# EasyEDA Pro project ESP32S3_DMX_RDM_2026-06-09.epro, board PCB_2
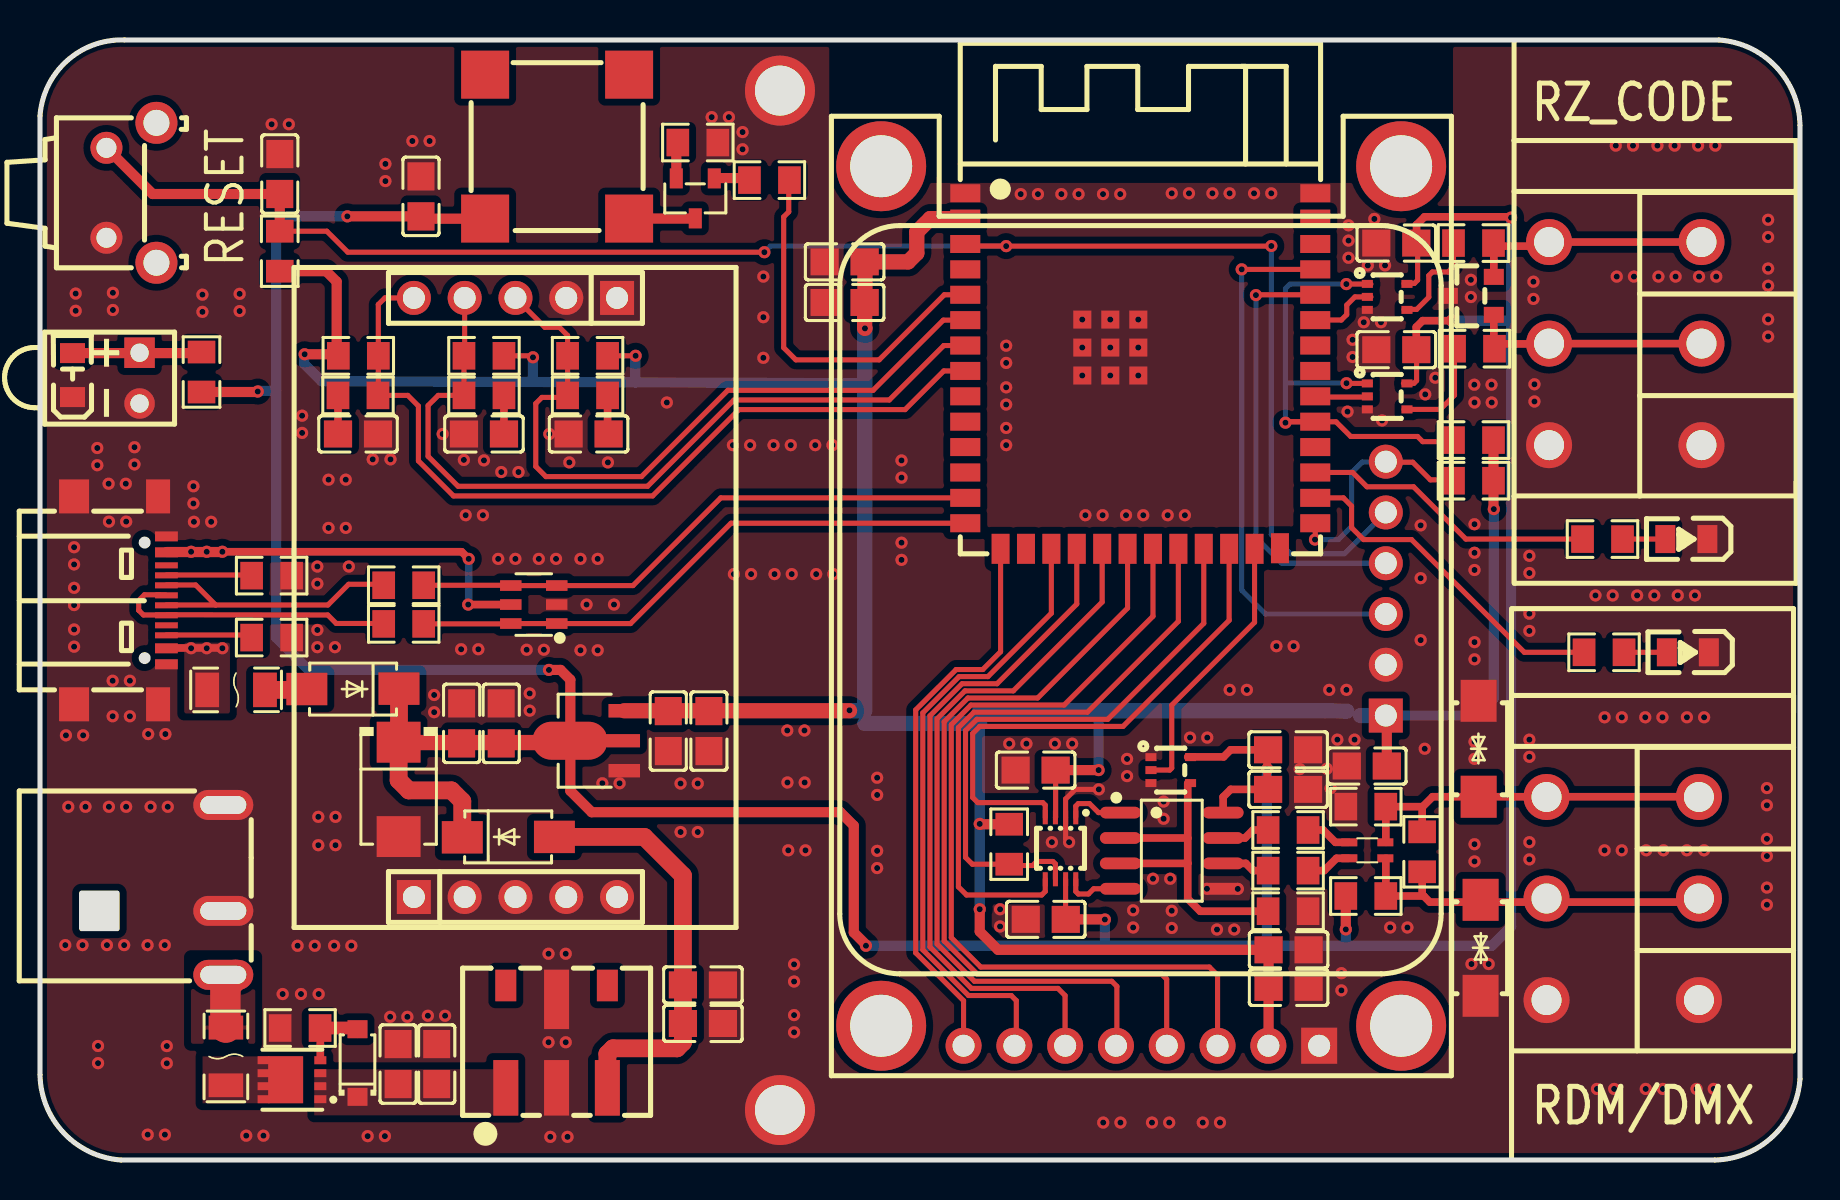
[diagram p19: board, top side]
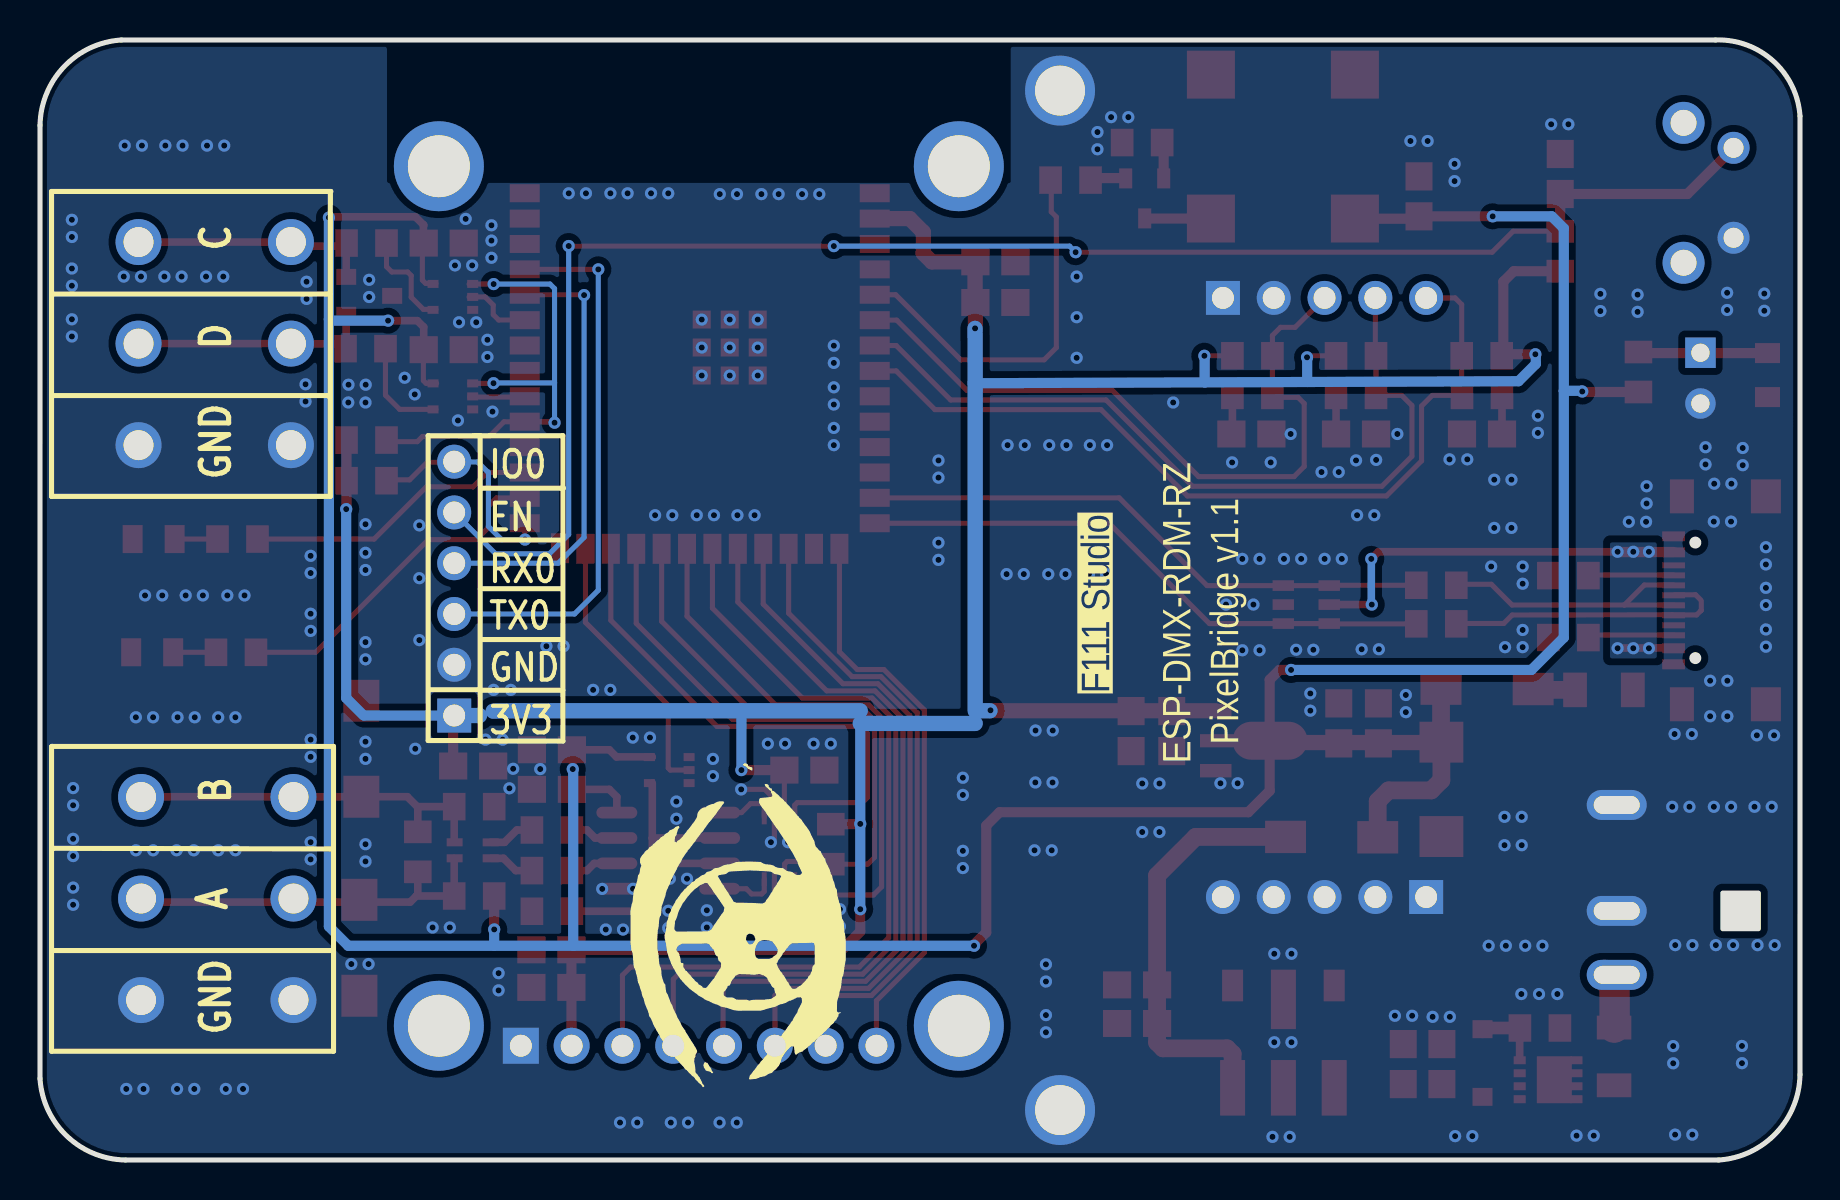
[diagram p20: board, bottom side, seen from below]

Outline 88 x 56.03 mm; copper layers: Top Layer, Bottom Layer. Coordinates in mm from the lower left corner of the outline.
Outline path: 0,52.22 0,4.27 arc(1.2,1.34) 4.06,0 83.74,0 arc(86.66,1.2) 88,4.06 88,51.76 arc(86.81,54.69) 83.94,56.03 4.22,56.03 arc(1.34,54.98) 0,52.22
Stack: Top Layer 0.035mm / Dielectric1 1.51mm FR4 er 4.5 / Bottom Layer 0.035mm

## Design rules (mm)
spacing copperThickness1oz (default): track to track 0.102, other pairs 0.152 to 0.3
spacing copperThickness2oz: track to track 0.203, other pairs 0.152 to 0.3
track width copperThickness1oz (default): min 0.127, default 0.254, max 2.54
track width copperThickness2oz: min 0.203, default 0.254, max 2.54
differential pair differentialPair (default): width min 0.127, default 0.254, max 2.54; gap min 0.152, default 0.152
net VBUS uses copperRegion2_copperThickness1oz
net GND uses copperRegion2_copperThickness1oz
pour e137 uses copperRegion2_default, default
net $2N68 uses copperRegion2_copperThickness1oz
net $2N66 uses copperRegion2_copperThickness1oz
net VCC_24V uses copperRegion
net $1N437 uses copperRegion2_copperThickness1oz

## Placement (name value [footprint] x y rotation side)
C1  100nF  [C0805]  21.08 21.84 270 top
C2  22uF  [C0805]  23.06 21.84 270 top
C3  100nF  [C0805]  50.29 12.04 180 top
C4  100nF  [C0805]  62.41 20.52 180 top
C5  100nF  [C0805]  62.41 18.54 180 top
C6  100nF  [C0805]  40.23 44.93 0 top
C7  100nF  [C0805]  33.45 21.46 90 top
C8  100nF  [C0805]  49.78 19.51 0 top
C9  100nF  [C0805]  66.34 19.71 0 top
C10  22uF  [C0805]  31.41 21.46 90 top
C11  10uF  [C0805]  40.23 42.9 0 top
C12  100nF  [C0805]  11.99 49.33 270 top
C13  100nF  [C0805]  67.82 40.54 0 top
C14  100nF  [C0805]  67.82 45.87 0 top
C15  100nF  [C0805]  62.43 8.64 180 top
C16  22uF  [C0805]  62.43 10.52 180 top
C20  10nF  [C0805]  22.2 36.32 0 top
C21  10nF  [C0805]  27.43 36.32 0 top
C22  10nF  [C0805]  15.9 36.32 180 top
C25  100nF  [C0805]  19.84 4.8 270 top
C26  10uF  [C0805]  17.91 4.8 90 top
C27  100nF  [C0805]  33.15 8.76 180 top
C28  22uF  [C0805]  33.15 6.83 180 top
C29  100nF  [C0805]  19.05 48.21 270 top
CN1  DB142R-5.08-3P-GN  [CONN-TH_3P-P5.08_DIBO_DB142R-5.08-3P]  79.14 13.08 90 top
CN2  DB142R-5.08-3P-GN  [CONN-TH_3P-P5.08_DIBO_DB142R-5.08-3P]  79.27 40.84 90 top
D1  PESD5V0S2BT,215  [SOT-23_L2.9-W1.3-P1.90-LS2.4-BR]  71.54 43.23 0 top
D2  USBLC6-2SC6  [SOT-23-6_L2.9-W1.6-P0.95-LS2.8-BL]  24.69 27.79 90 top
D7  SS34  [SMA_L4.3-W2.6-LS5.0-FD]  23.42 16.15 180 top
D8  SS34  [SMA_L4.3-W2.6-LS5.0-FD]  15.65 23.57 0 top
D9  BZT52C15Q  [SOD-123_L2.6-W1.7-LS3.5-RD]  15.88 4.85 90 top
DC2  DC044  [DC-IN-TH_DC044]  9.16 13.51 0 top
F1  1206L050/36NR  [F1206]  9.8 23.52 180 top
F2  1206L050/36NR  [F1206]  9.3 5.18 270 top
L1  ACM2012-900-2P-T002  [IND-SMD_4P-L2.0-W1.2-TL]  66.37 15.49 0 top
LED1  17-21SURC/S530-A2/4T  [LED0805-RD]  1.63 39.27 90 top
LED2  17-21/GHC-YR1S2/4T  [LED0805-R-RD_GREEN]  82.4 25.4 180 top
LED3  17-21/GHC-YR1S2/4T  [LED0805-R-RD_GREEN]  82.32 31.06 180 top
LED4  MHK1375CRBTD  [LED-TH_MHK1375CRBTD]  4.98 39.12 270 top
M1  -  [1.69_TFT_Mode]  70.56 4.22 180 top
NOREF  -  [Pad_e1178]  37 2.5 0 top
NOREF#2  -  [Pad_e1177]  37 53.5 0 top
Q4  HSBB6115  [DFN-8_L3.0-W3.0-P0.65-BL-1]  12.6 4.02 90 top
Q5  S8050  [SOT-23-3_L2.9-W1.3-P1.90-LS2.4-BR]  32.77 48.11 90 top
R1  10kΩ  [R0805]  11.99 45.47 270 top
R2  10kΩ  [R0805]  71.68 33.98 0 top
R4  5.1kΩ  [R0805]  11.58 29.24 0 top
R5  5.1kΩ  [R0805]  11.58 26.14 0 top
R6  1kΩ  [R0805]  8.08 39.42 270 top
R7  470Ω  [R0805]  78.13 31.06 180 top
R8  470Ω  [R0805]  78.21 25.4 180 top
R9  0Ω  [R0805]  62.41 14.48 180 top
R10  0Ω  [R0805]  62.41 16.51 180 top
R11  33R  [R0805]  71.73 40.59 180 top
R12  120R  [R0805]  69.11 15.42 90 top
R13  33R  [R0805]  71.68 45.87 180 top
R14  10kΩ  [R0805]  71.68 36.02 0 top
R15  10kΩ  [R0805]  62.41 12.45 0 top
R16  10kΩ  [R0805]  48.46 15.8 90 top
R17  1kΩ  [R0805]  66.29 17.68 180 top
R18  1kΩ  [R0805]  66.29 13.21 0 top
R19  0Ω  [R0805]  18.19 26.82 180 top
R20  0Ω  [R0805]  18.19 28.75 0 top
R21  100Ω  [R0805]  22.2 38.25 180 top
R22  100Ω  [R0805]  27.38 38.25 0 top
R23  100Ω  [R0805]  15.9 38.25 0 top
R24  1kΩ  [R0805]  36.47 49.02 180 top
R39  100kΩ  [R0805]  13 6.6 0 top
R40  4.7kΩ  [R0805]  22.2 40.23 0 top
R41  4.7kΩ  [R0805]  27.38 40.23 0 top
R42  4.7kΩ  [R0805]  15.92 40.23 180 top
R44  100Ω  [R0805]  32.89 50.9 180 top
SW1  KH-6X6X5H-ZJ  [SW-TH_KH-6X6X5H-ZJ]  4.57 48.39 270 top
TVS1  SMBJ5.0A  [SMB_L4.6-W3.6-LS5.3-RD]  17.93 18.54 270 top
U1  2.4GHz  [WIRELM-SMD_ESP32-S3-WROOM-1]  55.02 39.47 0 top
U2  THVD1450DR  [SOIC-8_L4.9-W3.9-P1.27-LS6.0-BL]  56.59 15.47 270 top
U3  TXS0102DCUR  [VSON8_L2.0-W2.3-P0.50-LS3.1-BL]  51.03 15.6 180 top
U4  AP7365-33YRG-13  [SOT-89-3_L4.5-W2.5-P1.50-LS4.2-BR]  27.86 20.98 0 top
U5  74HCT1G125GW-Q100H  [TSSOP-5_L2.1-W1.3-P0.65-LS2.2-BL]  56.54 19.51 270 top
U6  BX-PZ2.54-1-6PZZ  [HDR-TH_6P-P2.54-V-M]  67.29 28.59 90 bottom
U7  74HCT1G125GW-Q100H  [TSSOP-5_L2.1-W1.3-P0.65-LS2.2-BL]  67.36 43.18 270 top
U8  74HCT1G125GW-Q100H  [TSSOP-5_L2.1-W1.3-P0.65-LS2.2-BL]  67.36 38.2 270 top
U10  2.731kHz  [BUZ-SMD_4P-L8.5-W8.5-P8.50-TL-A]  25.86 50.7 90 top
U11  2541WV-05P  [HDR-TH_5P-P2.54-V-M]  23.77 13.16 0 top
U12  2541WV-05P  [HDR-TH_5P-P2.54-V-M]  23.77 43.13 180 top
U13  SMAJ12CA  [SMA_L4.3-W2.7-LS5.1-BI]  72.03 10.62 90 top
U14  SMAJ12CA  [SMA_L4.3-W2.7-LS5.1-BI]  71.94 20.57 270 top
U17  K7805MT-500R4  [PWRM-SMD_K78XXMT-500R4]  25.83 6.17 0 top
USB1  TYPE-C 16P QTWT  [USB-TYPE-C-SMD_TYPE-C-16P-QTWT]  4.01 28 270 top

## Footprints (pads in the part's own frame, mm; a bottom-side part is the same pattern mirrored in y, then rotated)
1.69_TFT_Mode
  rect 1.8x1.8 hole 1.1: 1(6.6,-1.5)
  round 1.8 hole 1.1: 2(9.14,-1.5) 3(11.68,-1.5) 4(14.22,-1.5) 5(16.76,-1.5) 6(19.3,-1.5) 7(21.84,-1.5) 8(24.38,-1.5)
  round 4.5 hole 3.1: 9(2.5,-2.5) 9(2.5,-45.5) 9(28.5,-2.5) 9(28.5,-45.5)
BUZ-SMD_4P-L8.5-W8.5-P8.50-TL-A
  rect 2.4x2.4 smd: 1(-3.6,3.6) 2(-3.6,-3.6) 3(3.599,-3.599) 4(3.6,3.6)
C0805
  rect 1.41x1.35 smd: 1(-1,0) 2(1,0)
CONN-TH_3P-P5.08_DIBO_DB142R-5.08-3P
  round 2.3 hole 1.5: 1(-5.08,3.81) 1(-5.08,-3.81) 2(0,3.81) 2(0,-3.81) 3(5.08,3.81) 3(5.08,-3.81)
DC-IN-TH_DC044
  oval 3x1.5 hole 2.3x0.9: 2(0,4.25) 3(0,-1.05) 4(0,-4.25)
DFN-8_L3.0-W3.0-P0.65-BL-1
  rect 0.4x0.6 smd: 1(-0.975,-1.419) 2(-0.325,-1.419) 3(0.325,-1.419) 4(0.975,-1.419) 5(-0.975,1.419) 5(-0.325,1.419) 5(0.325,1.419) 5(0.975,1.419)
  rect 2.35x1.75 smd: 5(0,0.315)
F1206
  rect 1.19x1.728 smd: 1(-1.445,0) 2(1.445,0)
HDR-TH_5P-P2.54-V-M
  rect 1.7x1.7 hole 1.1: 1(-5.08,0)
  round 1.7 hole 1.1: 2(-2.54,0) 3(0,0) 4(2.54,0) 5(5.08,0)
HDR-TH_6P-P2.54-V-M
  rect 1.7x1.7 hole 1.1: 1(-6.35,0)
  round 1.7 hole 1.1: 2(-3.81,0) 3(-1.27,0) 4(1.27,0) 5(3.81,0) 6(6.35,0)
IND-SMD_4P-L2.0-W1.2-TL
  rect 0.8x0.4 smd: 1(-0.901,0.399) 2(-0.899,-0.4) 3(0.9,-0.401) 4(0.901,0.401)
LED0805-R-RD_GREEN
  rect 1x1.399 smd: 1(1.05,0) 2(-1.05,0)
LED0805-RD
  rect 1x1.25 smd: 1(-1.1,0) 2(1.1,0)
LED-TH_MHK1375CRBTD
  rect 1.524x1.524 hole 0.914: 1(-1.27,0)
  round 1.524 hole 0.914: 2(1.27,0)
Pad_e1177
  round 3.5 hole 2.5: 1(0,0)
Pad_e1178
  round 3.5 hole 2.5: 1(0,0)
PWRM-SMD_K78XXMT-500R4
  rect 1.25x2.78 smd: 1(-2.54,-2.56) 2(0,-2.56) 3(2.54,-2.56)
  rect 1.05x1.58 smd: 4(2.54,2.56) 6(-2.54,2.56)
  rect 1.25x2.97 smd: 5(0,1.865)
R0805
  rect 1.133x1.377 smd: 1(-1,0) 2(1,0)
SMA_L4.3-W2.6-LS5.0-FD
  rect 2.046x1.62 smd: 1(-2.304,-0.009) 2(2.304,0.009)
SMA_L4.3-W2.7-LS5.1-BI
  rect 2.1x1.8 smd: 1(-2.4,0) 2(2.4,0)
SMB_L4.6-W3.6-LS5.3-RD
  rect 2.047x2.192 smd: 1(-2.361,0) 2(2.361,0)
SOD-123_L2.6-W1.7-LS3.5-RD
  rect 0.9x1 smd: 1(-1.692,0) 2(1.692,0)
SOIC-8_L4.9-W3.9-P1.27-LS6.0-BL
  oval 0.588x2.045 smd: 1(-1.905,-2.57) 2(-0.635,-2.57) 3(0.635,-2.57) 4(1.905,-2.57) 5(1.905,2.57) 6(0.635,2.57) 7(-0.635,2.57) 8(-1.905,2.57)
SOT-23-3_L2.9-W1.3-P1.90-LS2.4-BR
  rect 1x0.65 smd: 1(1,-0.95) 2(1,0.95) 3(-1,0)
SOT-23-6_L2.9-W1.6-P0.95-LS2.8-BL
  rect 0.532x1.072 smd: 1(-0.95,-1.149) 2(0,-1.149) 3(0.95,-1.149) 4(0.95,1.149) 5(0,1.149) 6(-0.95,1.149)
SOT-23_L2.9-W1.3-P1.90-LS2.4-BR
  rect 1x0.8 smd: 1(1.15,-0.95) 2(1.15,0.95) 3(-1.15,0)
SOT-89-3_L4.5-W2.5-P1.50-LS4.2-BR
  rect 1.575x0.672 smd: 1(1.356,-1.5) 3(1.356,1.5)
  custom 5.377x1.9 smd: 2(-1.356,0)
SW-TH_KH-6X6X5H-ZJ
  round 1.6 hole 1: 1(-2.25,-1.25) 2(2.25,-1.25)
  round 2.1 hole 1.3: 3(-3.5,1.25) 4(3.5,1.25)
TSSOP-5_L2.1-W1.3-P0.65-LS2.2-BL
  rect 0.399x0.551 smd: 1(-0.65,-0.991) 2(0,-0.991) 3(0.65,-0.991) 4(0.65,0.991) 5(-0.65,0.991)
USB-TYPE-C-SMD_TYPE-C-16P-QTWT
  rect 1.7x1.2 smd: 0(-5.2,1.891) 0(5.2,1.891)
  rect 1.7x1.5 smd: 0(-5.2,-2.309) 0(5.2,-2.309)
  rect 0.5x1.14 smd: A1(-3.2,2.308) A4(-2.4,2.308) A9(2.4,2.308) A12(3.2,2.308)
  rect 0.3x1.14 smd: A5(-1.25,2.308) A6(-0.25,2.308) A7(0.25,2.308) A8(1.25,2.309) B5(1.75,2.308) B6(0.75,2.308) B7(-0.75,2.308) B8(-1.75,2.309)
VSON8_L2.0-W2.3-P0.50-LS3.1-BL
  rect 0.25x0.7 smd: 1(-0.762,-1.55) 2(-0.254,-1.55) 3(0.254,-1.55) 4(0.762,-1.55) 5(0.762,1.55) 6(0.254,1.55) 7(-0.254,1.55) 8(-0.762,1.55)
WIRELM-SMD_ESP32-S3-WROOM-1
  rect 1.5x0.9 smd: 1(-8.75,8.895) 2(-8.75,7.625) 3(-8.75,6.355) 4(-8.75,5.085) 5(-8.75,3.815) 6(-8.75,2.545) 7(-8.75,1.275) 8(-8.75,0.005) 9(-8.75,-1.265) 10(-8.75,-2.535) 11(-8.75,-3.805) 12(-8.75,-5.075) 13(-8.75,-6.345) 14(-8.75,-7.615) 27(8.75,-7.615) 28(8.75,-6.345) 29(8.75,-5.075) 30(8.75,-3.805) 31(8.75,-2.535) 32(8.75,-1.265) 33(8.75,0.005) 34(8.75,1.275) 35(8.75,2.545) 36(8.75,3.815) 37(8.75,5.085) 38(8.75,6.355) 39(8.75,7.625) 40(8.75,8.895)
  rect 0.9x1.5 smd: 15(-6.985,-8.895) 16(-5.715,-8.895) 17(-4.445,-8.895) 18(-3.175,-8.895) 19(-1.905,-8.895) 20(-0.635,-8.895) 21(0.635,-8.895) 22(1.905,-8.895) 23(3.175,-8.895) 24(4.445,-8.895) 25(5.715,-8.895) 26(6.985,-8.865)
  rect 0.9x0.9 smd: 41(-2.9,2.575) 41(-2.9,1.175) 41(-2.9,-0.225) 41(-1.5,2.575) 41(-1.5,1.175) 41(-1.5,-0.225) 41(-0.1,2.575) 41(-0.1,1.175) 41(-0.1,-0.225)

## Nets
+3.3V: C6.2 C7.2 C8.2 C9.2 C10.2 C11.2 C15.2 C16.2 M1.2 R1.2 R2.2 R14.2 R16.2 R40.2 R41.2 R42.2 U1.2 U3.3 U4.3 U6.1
+5V: C1.2 C2.2 C3.1 C4.2 C5.2 C13.2 C14.2 C29.2 D7.2 D8.2 R6.2 R18.1 TVS1.1 U2.8 U3.7 U4.2 U5.5 U7.5 U8.5 U10.1
GND: C1.1 C2.1 C3.2 C4.1 C5.1 C6.1 C7.1 C8.1 C9.1 C10.1 C11.1 C12.1 C13.1 C14.1 C15.1 C16.1 C20.1 C21.1 C22.1 C25.1 C26.2 C27.1 C28.1 C29.1 CN1.1 CN2.1 D1.3 D2.2 DC2.2 DC2.3 LED1.1 LED2.2 LED3.2 LED4.2 M1.1 NOREF.1 NOREF#2.1 R4.2 R5.2 R15.2 R17.2 R39.1 R44.1 SW1.2 TVS1.2 U1.1 U1.40 U1.41 U2.5 U3.2 U4.1 U5.1 U5.3 U6.2 U7.3 U8.3 U11.1 U11.2 U11.3 U11.4 U11.5 U12.1 U12.2 U13.1 U14.1 U17.2 U17.5 USB1.0 USB1.A1 USB1.A12
VBUS: D2.5 F1.2 USB1.A4 USB1.A9
VCC_24V: DC2.4 F2.1
A: R21.2 R40.1 U1.7 U12.4
B: R23.2 R42.1 U1.8 U12.5
BEEP: R24.1 U1.5
DMX_EN: U1.25 U5.2
DMX_OE: R16.1 U1.23 U3.6
DMX_RX: U1.24 U3.4
DMX_TX: U1.22 U3.5
EN: C12.2 R1.1 SW1.1 U1.3 U6.5
ENCODER_A: C20.2 R21.1
ENCODER_B: C22.2 R23.1
ENCODER_KEY: C21.2 R22.2
IO0: R2.1 U1.27 U6.6
IO3: M1.8 U1.15
IO4: U1.4
IO8: U1.12
IO9: M1.7 U1.17
IO10: M1.6 U1.18
IO11: M1.5 U1.19
IO12: M1.4 U1.20
IO13: M1.3 U1.21
IO16: U1.9
IO17: U1.10
IO18: U1.11
IO35: R8.2 U1.28
IO36: R7.2 U1.29
IO37: U1.30
IO40: U1.33
IO41: U1.34
IO45: U1.26
IO46: U1.16
KEY: R22.1 R41.1 U1.6 U12.3
RXD0: U1.36 U6.4
RZ_CLK: U1.35 U7.2
RZ_DATA: U1.32 U8.2
RZ_OE: R14.1 U1.31 U7.1 U8.1
TXD0: U1.37 U6.3
USB_DN: D2.3 D2.4 R20.2 U1.13
USB_DP: D2.1 D2.6 R19.1 U1.14
$1N204: R4.1 USB1.A5
$1N205: R5.1 USB1.B5
$1N232: U1.39
$1N233: U1.38
$1N288: R15.1 U2.2 U2.3 U5.4
$1N299: R11.2 U8.4
$1N306: U2.1 U3.1
$1N311: U2.4 U3.8
$1N321: CN2.2 D1.1 R11.1
$1N328: R13.2 U7.4
$1N333: CN2.3 D1.2 R13.1
$1N343: LED2.1 R8.1
$1N352: CN1.3 L1.4 R12.2 R17.1 U14.2
$1N354: CN1.2 L1.3 R12.1 R18.2 U13.2
$1N357: R10.2 U2.7
$1N358: R9.2 U2.6
$1N359: LED3.1 R7.1
$1N412: R19.2 USB1.A6 USB1.B6
$1N414: R20.1 USB1.A7 USB1.B7
$1N435: LED1.2 LED4.1 R6.1
$1N437: D8.1 F1.1
$1N442: L1.1 R10.1
$1N443: L1.2 R9.1
$2N13: D9.2 Q4.4 R39.2
$2N41: C27.2 C28.2 D7.1 U17.3
$2N58: Q5.3 U10.2
$2N66: C25.2 C26.1 D9.1 Q4.1 Q4.2 Q4.3 U17.1
$2N68: F2.2 Q4.5
$2N72: Q5.1 R24.2
$2N73: Q5.2 R44.2

Pads without a net: M1 9; SW1 3 4; U10 3 4; U17 4 6; USB1 A8 B8

## Via types
v1: diameter 0.61, hole 0.305, Top Layer to Bottom Layer, 378 vias

## Routing (per net, layer and track width the routed paths; a pad name or vN(x,y) marks a point on that pad's centre or on a via; arc(x,y) is an arc through that point)
+3.3V: length 169.5
  Top Layer w0.254: R40.2 24.57,40.23 v1(24.65,40.16) ; 28.73,40.23 v1(29.78,40.23) ; U3.3 50.78,17.16 C8.2
  Top Layer w0.508: R14.2 R2.2 72.68,32.58 v1(72.69,32.56) ; 14.84,40.31 v1(13.23,40.31) ; 14.84,40.31 R42.2 ; 14.84,40.31 14.83,40.32 14.83,43.94 14.31,44.47 R1.2 ; M1.2 61.43,5.73 C15.2 C16.2 47.9,10.52 46.99,11.43 v1(46.99,12.55) ; C8.2 v1(52.93,19.51) ; U6.1 67.34,22.19 C9.2 ; R16.2 47.01,16.8 v1(46.99,16.81)
  Top Layer w0.762: U4.3 40.48,22.48 ; U1.2 44.51,47.1 43.84,46.42 43.84,45.36 43.41,44.93 41.25,44.93 41.25,42.92 C11.2 41.23,41.62 v1(41.25,41.61)
  Top Layer w0.889: C6.2 41.25,44.93
  Bottom Layer w0.508: v1(29.78,40.23) 29.77,40.22 29.77,38.9 ; 41.24,38.86 29.77,38.9 ; 29.77,38.9 24.64,38.92 ; 71.82,22.24 72.69,23.11 v1(72.69,32.56) ; 24.64,38.92 24.64,40.15 v1(24.65,40.16) ; 24.64,38.92 14.07,38.96 13.21,39.83 13.21,40.26 ; U6.1 71.77,22.24 ; v1(46.99,12.55) v1(46.99,16.81) 46.99,22.47 ; 52.94,22.47 52.93,22.47 52.93,19.51 v1(52.93,19.51)
  Bottom Layer w0.762: 65.35,22.46 64.24,22.48 52.94,22.47 46.99,22.47 ; 66.03,22.24 U6.1 ; v1(41.25,41.61) 41.24,38.86 41.24,22.47 ; 41.24,21.84 46.99,21.84 ; 40.5,22.47 41.21,22.47
  vias: v1(40.48,22.5)
+5V: length 206.1
  Top Layer w0.254: 68.82,40.74 68.83,40.73 68.83,38.99 68.7,38.86 68.18,38.86 ; 68.83,45.88 68.82,45.9 ; U3.7 51.28,12.05 C3.1 ; 68.88,45.69 68.88,44.02 68.72,43.86 68.21,43.86
  Top Layer w0.381: 61.36,20.52 61.36,18.54 ; 61.36,20.52 59.54,20.52 59.18,20.17 57.4,20.17 57.39,20.16 ; 61.36,20.52 C4.2 ; 61.36,18.54 C5.2 ; 61.36,18.54 59.54,18.54 59.16,18.17 U2.8 ; 68.82,40.74 68.82,41.67 69.14,41.99 v1(70.6,41.99) ; 68.83,45.76 68.76,45.69 ; 68.81,46.76 68.83,46.79 ; 68.83,46.79 69.23,47.19 73.49,47.19 73.54,47.14 ; 68.83,46.79 68.83,45.88
  Top Layer w0.508: v1(25.45,24.52) 26.03,24.52 26.52,24.03 26.52,20.96 ; R18.1 v1(65.29,11.54) ; R6.2 10.86,38.42 v1(10.89,38.45) ; 26.52,20.96 26.52,18.47 27.59,17.4 40.02,17.4 40.69,16.73 40.69,11.38 41.31,10.77 ; 26.52,20.96 26.5,20.98 ; 19.05,47.09 22.25,47.09 22.26,47.1 ; v1(53.25,12.03) 53.24,12.04 C3.1 ; C29.2 v1(15.37,47.21)
  Top Layer w0.762: 18.24,20.88 26.41,20.88
  Top Layer w0.889: D8.2 17.95,20.92 TVS1.1 17.93,19 18.44,18.49 20.57,18.49 21.11,17.95 D7.2
  Bottom Layer w0.508: v1(41.3,10.72) 53.25,10.72 ; 53.25,10.72 v1(53.25,12.03) ; 53.25,10.72 61.34,10.72 ; v1(61.37,19.56) 61.34,19.54 61.34,10.72 ; 11.81,38.48 10.92,38.48 v1(10.89,38.45) ; 11.81,38.48 11.81,26.14 13.43,24.52 v1(25.45,24.52) ; 11.81,38.48 11.81,46.61 12.41,47.21 v1(15.37,47.21) ; 65.3,10.72 72.59,10.72 73.56,11.68 73.56,42.06 ; 65.3,10.72 65.3,11.53 ; 65.3,10.72 61.34,10.72 ; v1(70.6,41.99) 73.49,41.99 73.56,42.06 ; 73.56,42.06 v1(73.56,47.15)
GND: length 4.1
  Top Layer w0.254: v1(51.46,15.9) 51.28,16.08 U3.2 51.28,18.06 51.76,18.54 v1(52.94,18.54)
  vias: v1(1.3,21.25) v1(1.26,10.75) v1(1.41,17.67) v1(1.7,30.66) v1(1.7,29.8) v1(1.7,28.62) v1(1.7,27.76) v1(1.7,26.54) v1(1.7,25.68) v1(1.78,43.35) v1(1.78,42.48) v1(2.12,10.75) v1(2.16,21.25) v1(2.28,17.67) v1(2.86,35.62) v1(2.86,34.76) v1(2.9,5.71) v1(2.9,4.85) v1(3.35,10.75) v1(3.43,33.83) v1(3.45,31.94) v1(3.45,17.67) v1(3.64,43.39) v1(3.64,42.52) v1(3.63,23.98) v1(3.63,22.2) v1(4.21,10.75) v1(4.29,33.83) v1(4.31,31.94) v1(4.31,17.67) v1(4.49,23.98) v1(4.49,22.2) v1(4.72,35.66) v1(4.72,34.8) v1(5.41,21.31) v1(5.38,10.75) v1(5.39,1.27) v1(5.53,17.67) v1(6.24,10.75) v1(6.25,1.27) v1(6.27,21.31) v1(6.34,5.7) v1(6.34,4.84) v1(6.39,17.67) v1(7.67,33.71) v1(7.67,32.84) v1(7.7,31.93) v1(8.12,43.29) v1(8.12,42.43) v1(8.56,31.93) v1(9.98,43.33) v1(9.98,42.47) v1(10.31,1.22) v1(11.17,1.22) v1(11.58,51.82) v1(12.13,8.3) v1(12.44,51.82) v1(12.88,10.72) v1(13.05,8.3) v1(13.11,37.24) v1(13.11,36.38) v1(13.74,10.72) v1(13.87,29.69) v1(13.87,28.83) v1(13.87,26.52) v1(13.87,25.66) v1(13.92,17.17) v1(13.92,15.75) v1(13.93,8.3) v1(14.43,34.04) v1(14.43,31.62) v1(14.75,25.66) v1(14.71,10.72) v1(14.78,17.17) v1(14.78,15.75) v1(15.29,34.04) v1(15.29,31.62) v1(15.44,29.69) v1(15.57,10.72) v1(16.38,1.2) v1(16.64,35.05) v1(17.25,1.2) v1(17.27,49.83) v1(17.27,48.97) v1(17.53,35.05) v1(17.51,7.16) v1(18.37,7.16) v1(18.62,50.98) v1(19.4,7.22) v1(19.48,50.98) v1(19.71,23.27) v1(19.71,22.4) v1(20.13,36.32) v1(20.26,7.22) v1(21.06,25.55) v1(21.19,35.02) v1(21.29,32.26) v1(21.92,25.55) v1(22.15,32.26) v1(22.2,35) v1(22.91,30.07) v1(23.06,34.42) v1(23.77,30.07) v1(23.93,34.42) v1(24.33,25.53) v1(24.49,23.34) v1(24.49,22.48) v1(24.94,30.07) v1(25.2,25.53) v1(25.43,10.32) v1(25.43,5.89) v1(25.47,36.32) v1(25.52,1.16) v1(25.8,30.07) v1(26.29,10.32) v1(26.29,5.89) v1(26.38,1.16) v1(26.47,34.9) v1(27.03,30.07) v1(27.03,25.5) v1(27.33,27.79) v1(27.89,30.07) v1(27.89,25.5) v1(28.12,18.85) v1(28.4,34.9) v1(28.7,27.79) v1(28.98,18.85) v1(31.34,37.9) v1(32.03,18.84) v1(32.03,16.41) v1(32.89,18.84) v1(32.89,16.41) v1(33.59,52.17) v1(34.45,52.17) v1(34.65,35.76) v1(34.7,29.31) v1(35.13,51.42) v1(35.13,50.56) v1(35.51,35.76) v1(35.56,29.31) v1(36.17,44.2) v1(36.17,42.16) v1(36.17,40.13) v1(36.68,35.76) v1(36.73,29.31) v1(37.37,21.49) v1(37.38,18.89) v1(37.42,15.49) v1(37.54,35.76) v1(37.59,29.31) v1(37.71,9.79) v1(37.71,8.93) v1(37.71,7.25) v1(37.71,6.39) v1(38.23,21.49) v1(38.24,18.89) v1(38.28,15.49) v1(38.76,35.76) v1(38.81,29.31) v1(39.62,35.76) v1(39.67,29.31) v1(41.86,19.12) v1(41.86,18.26) v1(41.86,15.47) v1(41.86,14.61) v1(43.08,35) v1(43.08,34.14) v1(43.08,30.88) v1(43.08,30.02) v1(48.01,12.54) v1(48.01,11.68) v1(48.31,40.74) v1(48.31,39.88) v1(48.31,38.66) v1(48.31,37.8) v1(48.31,36.62) v1(48.31,35.76) v1(48.46,20.83) v1(49.04,48.32) v1(49.32,20.83) v1(49.9,48.32) v1(50.6,15.9) v1(50.75,20.83) v1(51.07,48.32) v1(51.61,20.83) v1(51.93,48.32) v1(52.12,42.05) v1(52.12,40.65) v1(52.12,39.25) v1(52.27,32.26) v1(53.13,32.26) v1(53.15,48.32) v1(53.16,1.87) v1(53.52,42.05) v1(53.52,40.65) v1(53.52,39.25) v1(54.01,48.32) v1(54.02,1.87) v1(54.31,32.26) v1(54.36,20.07) v1(54.36,19.21) v1(54.66,12.49) v1(54.66,11.63) v1(54.92,42.05) v1(54.92,40.65) v1(54.92,39.25) v1(55.17,32.26) v1(55.6,1.87) v1(55.65,14.07) v1(56.19,17.93) v1(56.19,17.07) v1(56.39,32.26) v1(56.51,14.07) v1(56.46,1.87) v1(56.59,48.36) v1(56.59,12.47) v1(56.59,11.61) v1(57.25,32.26) v1(57.45,48.36) v1(57.51,21.13) v1(58.14,1.87) v1(58.35,13.57) v1(58.37,21.13) v1(58.62,48.36) v1(58.85,11.53) v1(59,1.87) v1(59.48,48.36) v1(59.49,23.52) v1(59.71,11.53) v1(59.89,13.56) v1(60.35,23.52) v1(60.71,48.36) v1(61.57,48.36) v1(61.82,25.7) v1(62.68,25.7) v1(62.99,19.56) v1(64.35,19.57) v1(64.47,23.52) v1(64.53,18.6) v1(64.87,21.03) v1(65.07,9.35) v1(65.07,8.49) v1(65.33,23.52) v1(65.43,46.76) v1(65.43,46) v1(65.43,45.14) v1(65.38,37.44) v1(65.63,41.03) v1(65.63,40.17) v1(65.73,21.03) v1(66.19,41.91) v1(66.4,44.75) v1(66.72,47.08) v1(67.05,41.91) v1(67.11,37) v1(67.26,44.75) v1(67.51,11.63) v1(68.37,11.63) v1(69.04,31.75) v1(69.04,29.11) v1(69.04,26.01) v1(69.24,20.57) v1(69.27,38.3) v1(69.77,39.13) v1(71.55,44.03) v1(71.55,43.17) v1(71.58,9.8) v1(71.72,38.79) v1(71.73,37.9) v1(71.73,31.81) v1(71.73,30.38) v1(71.73,29.52) v1(71.73,25.91) v1(71.73,25.05) v1(71.73,20.93) v1(71.73,20.07) v1(71.73,15.8) v1(71.73,14.94) v1(72.44,9.8) v1(72.58,38.79) v1(72.59,37.9) v1(74.47,30.23) v1(74.47,29.37) v1(74.47,27.33) v1(74.47,26.47) v1(74.47,21.03) v1(74.47,20.17) v1(74.47,15.9) v1(74.47,15.04) v1(74.68,43.94) v1(74.68,43.08) v1(74.73,38.81) v1(74.73,37.95) v1(77.78,28.25) v1(77.85,3.56) v1(78.24,22.15) v1(78.23,15.49) v1(78.64,28.25) v1(78.71,3.56) v1(78.79,50.75) v1(78.84,44.2) v1(79.1,22.15) v1(79.09,15.49) v1(79.65,50.75) v1(79.7,44.2) v1(79.86,28.25) v1(80.27,22.15) v1(80.31,15.49) v1(80.29,3.56) v1(80.72,28.25) v1(80.88,50.75) v1(80.92,44.2) v1(81.13,22.15) v1(81.18,15.49) v1(81.15,3.56) v1(81.74,50.75) v1(81.78,44.2) v1(81.89,28.25) v1(82.35,22.15) v1(82.35,15.49) v1(82.75,28.25) v1(82.83,3.56) v1(82.91,50.75) v1(82.96,44.2) v1(83.21,22.15) v1(83.21,15.49) v1(83.69,3.56) v1(83.77,50.75) v1(83.82,44.2) v1(86.35,18.61) v1(86.35,17.75) v1(86.35,16.07) v1(86.35,15.21) v1(86.35,13.63) v1(86.35,12.77) v1(86.41,47.04) v1(86.41,46.18) v1(86.41,44.6) v1(86.41,43.74) v1(86.41,42.06) v1(86.41,41.2)
VBUS: length 22.5
  Top Layer w0.381: 9.05,25.62 6.32,25.62 ; v1(9.12,25.6) 9.08,25.65 ; v1(21.44,30.07) 21.08,30.43 v1(9.12,30.43) ; D2.5 v1(21.41,27.79)
  Top Layer w0.508: 6.32,30.42 9.11,30.42 v1(9.12,30.43)
  Bottom Layer w0.381: v1(21.44,30.07) 21.44,27.81 v1(21.41,27.79)
  vias: v1(7.56,30.43) v1(7.56,25.6) v1(8.34,30.43) v1(8.34,25.6)
VCC_24V: length 2.9
  Top Layer w1.524: F2.1 9.27,6.65 9.27,8.76 9.77,9.26
A: length 39.8
  Top Layer w0.254: R21.2 R40.1 21.23,40.27 U12.4 ; 21.15,38.25 19.91,38.25 19.41,37.74 19.41,35.2 20.9,33.71 30.38,33.71 34.7,38.02 42.47,38.02 45.19,40.75 U1.7
B: length 42.1
  Top Layer w0.254: U1.8 45.19,39.48 43.26,37.54 34.95,37.54 30.63,33.22 20.68,33.22 18.92,34.98 18.92,37.72 18.39,38.25 R23.2 16.92,38.27 R42.1 16.92,42.8 17.25,43.13 U12.5
BEEP: length 19.2
  Top Layer w0.254: U1.5 45.22,43.29 41.96,40.03 37.79,40.03 37.19,40.64 37.19,47.18 37.44,47.44 37.44,48.99 R24.1
DMX_EN: length 13.4
  Top Layer w0.254: 55.69,19.51 56.49,19.51 56.59,19.61 56.59,22.76 60.73,26.9 60.73,30.37
DMX_OE: length 29.6
  Top Layer w0.254: U3.6 50.77,14.81 50.65,14.94 49.84,14.94 49.63,14.73 48.53,14.73 R16.1 46.62,14.8 46.28,15.14 46.28,21.48 46.84,22.05 53.39,22.05 58.19,26.85 58.19,30.37
DMX_RX: length 26.1
  Top Layer w0.254: U3.4 50.27,17.75 50.14,17.88 46.89,17.88 46.63,18.14 46.63,21.34 46.99,21.69 54.15,21.69 59.46,27 59.46,30.37
DMX_TX: length 29.8
  Top Layer w0.254: 56.92,30.37 56.92,26.95 52.38,22.4 46.69,22.4 45.92,21.63 45.92,13.67 46.33,13.26 50.09,13.26 50.27,13.44 U3.5
EN: length 85.6
  Top Layer w0.254: v1(61.57,45.72) 61.56,45.72 v1(48.31,45.72) 48.31,45.72 46.69,45.72 ; R1.1 14.34,46.47 15.39,45.42 v1(36.22,45.42) ; 46.69,45.72 46.37,45.72 U1.3 46.59,45.83 46.69,45.72
  Top Layer w0.508: R1.1 C12.2 5.63,48.33 SW1.1
  Bottom Layer w0.254: v1(61.57,45.72) 61.57,31.29 62.53,30.33 65.23,30.33 U6.5 ; v1(48.31,45.72) 36.53,45.72 v1(36.22,45.42)
ENCODER_A: length 1.9
  Top Layer w0.381: C20.2 R21.1
ENCODER_B: length 2
  Top Layer w0.381: 14.9,36.27 R23.1
ENCODER_KEY: length 2
  Top Layer w0.381: C21.2 28.38,36.37 R22.2
IO0: length 11.7
  Top Layer w0.254: U1.27 63.77,31.05 v1(63.75,31.04) ; 67.28,34.91 68.64,34.91 69.52,34.03 70.62,34.03
  Bottom Layer w0.254: 65.58,34.42 65.58,31.7 64.92,31.04 v1(63.75,31.04) ; 65.62,34.42 66.12,34.92 67.28,34.92 ; 66.97,35.31 67.29,34.99
IO3: length 28.2
  Top Layer w0.254: M1.8 46.18,7.97 43.79,10.37 43.79,22.52 45.81,24.54 47.14,24.54 48.03,25.43 48.03,30.37
IO9: length 31.4
  Top Layer w0.254: M1.7 48.82,5.81 48.82,7.98 48.56,8.23 46.43,8.23 44.14,10.51 44.14,22.37 45.96,24.18 47.4,24.18 50.57,27.36 50.57,30.37
IO10: length 34.1
  Top Layer w0.254: M1.6 51.26,5.72 51.26,8.23 50.9,8.59 46.57,8.59 44.5,10.66 44.5,22.22 46.1,23.83 47.86,23.83 51.84,27.81 51.84,30.37
IO11: length 37.3
  Top Layer w0.254: 53.8,5.72 53.85,5.76 53.85,8.69 53.59,8.94 46.72,8.94 44.85,10.81 44.85,22.07 46.25,23.47 48.67,23.47 53.11,27.91 53.11,30.37
IO12: length 40.5
  Top Layer w0.254: 54.38,30.37 54.38,27.61 49.89,23.11 46.4,23.11 45.21,21.93 45.21,10.96 46.87,9.3 56.08,9.3 56.34,9.04 56.34,5.72 M1.4
IO13: length 43.8
  Top Layer w0.254: 55.65,30.37 55.65,27.2 51.21,22.76 46.55,22.76 45.57,21.78 45.57,11.13 47.04,9.65 58.47,9.65 58.88,9.24 M1.3
IO35: length 17.3
  Top Layer w0.254: R8.2 74.22,25.4 68.58,31.04 66.18,31.04 65.58,31.64 65.58,32.72 65.17,33.13 U1.28
IO36: length 14.7
  Top Layer w0.254: U1.29 65.63,34.4 66.35,33.68 68.68,33.68 71.3,31.06 R7.2
KEY: length 36.2
  Top Layer w0.254: U1.6 45.17,42.02 41.66,38.51 34.39,38.51 30.07,34.19 25.3,34.19 24.79,34.7 24.79,37.85 25.09,38.15 26.28,38.15 R22.1 R41.1 26.38,41.25 25.97,41.66 25.25,41.66 U12.3
RXD0: length 22.3
  Top Layer w0.254: v1(60.8,43.27) 60.82,43.29 U1.36
  Bottom Layer w0.254: 67.69,29.46 67.8,29.35 ; v1(60.8,43.27) 60.8,31.15 62.09,29.86 U6.4
RZ_CLK: length 3.5
  Top Layer w0.254: 63.77,42.02 65.07,42.02 65.34,42.29 ; 66.55,43.18 65.75,43.18 65.34,42.77 65.34,42.29
RZ_DATA: length 2.9
  Top Layer w0.254: 63.58,38.17 66.52,38.17
RZ_OE: length 25.4
  Top Layer w0.254: v1(65.33,38.86) 65.34,38.85 66.51,38.85 ; v1(65.32,43.82) 66.55,43.82 ; 70.52,35.94 69.14,35.94 68.88,36.2 65.54,36.2 64.81,36.93 62.32,36.93 ; U1.31 62.33,36.94
  Top Layer w0.381: 62.32,36.93 v1(62.28,36.89)
  Bottom Layer w0.254: v1(62.28,36.89) 62.28,38.88 ; 62.28,38.88 65.32,38.88 v1(65.33,38.86) ; 62.28,38.88 62.28,43.59 62.5,43.82 v1(65.32,43.82)
TXD0: length 27.4
  Top Layer w0.254: U1.37 v1(60.09,44.56)
  Bottom Layer w0.254: U6.3 61.28,27.32 60.09,28.51 v1(60.09,44.56) ; 67.79,26.82 67.8,26.81
USB_DN: length 28.9
  Top Layer w0.254: U1.13 34.04,33.13 29.65,28.74 D2.3 D2.4 23.52,28.75 R20.2
USB_DP: length 29.2
  Top Layer w0.254: U1.14 34.55,31.86 29.53,26.84 D2.1 D2.6 23.52,26.82 R19.1
$1N204: length 4.3
  Top Layer w0.254: 6.32,29.27 10.55,29.27 R4.1
$1N205: length 4.4
  Top Layer w0.254: 10.5,26.01 10.58,25.93 ; R5.1 10.45,26.27 6.32,26.27
$1N288: length 16.8
  Top Layer w0.381: 57.39,18.86 57.39,16.1 ; 57.39,16.1 57.38,16.11 54.02,16.11 ; 57.39,16.1 57.39,14.85 ; 57.39,14.85 57.39,13.07 58.01,12.45 R15.1 ; 57.39,14.85 57.38,14.84 54.02,14.84
$1N299: length 5.5
  Top Layer w0.254: 70.73,41 70.73,38.26 70.02,37.55 68.21,37.55
$1N306: length 3
  Top Layer w0.254: U3.1 51.79,17.7 51.92,17.83 52.48,17.83 52.93,17.38 54.02,17.38
$1N311: length 3
  Top Layer w0.254: 54.02,13.57 52.69,13.57 52.43,13.31 51.92,13.31 51.79,13.44 U3.8
$1N321: length 11.9
  Top Layer w0.381: 75.67,40.83 72.66,40.83 72.63,40.86 ; 72.69,41.03 D1.1 ; 83.21,40.84 75.59,40.84
$1N328: length 5.4
  Top Layer w0.254: 69.44,43.16 68.84,42.55 68.21,42.55 ; 70.68,46.08 70.68,44.69 70.41,44.43 69.62,44.43 69.44,44.25 69.44,43.17
$1N333: length 11.9
  Top Layer w0.381: 83.21,45.92 75.59,45.92 ; 75.59,45.72 72.76,45.72 72.69,45.79 72.69,44.38
$1N343: length 2.1
  Top Layer w0.254: R8.1 LED2.1
$1N352: length 19.2
  Top Layer w0.381: 67.29,15.89 67.29,17.68 ; R12.2 69.11,17.68 ; 69.11,17.68 R17.1 ; 69.11,17.68 69.14,17.68 69.63,18.17 U14.2 83.19,18.17 83.21,18.16
$1N354: length 19.2
  Top Layer w0.381: 67.29,15.09 67.29,13.21 ; R12.1 69.11,13.28 69.19,13.21 ; 69.19,13.21 69.49,12.9 83.03,12.9 83.21,13.08 ; 69.19,13.21 R18.2
$1N357: length 2.4
  Top Layer w0.381: R10.2 60.66,16.51 60.25,16.11 U2.7
$1N358: length 2.4
  Top Layer w0.381: U2.6 60.29,14.84 60.66,14.48 R9.2
$1N359: length 2.1
  Top Layer w0.254: R7.1 LED3.1
$1N412: length 14.6
  Top Layer w0.254: 17.19,27.08 17.19,26.84 14.81,26.84 14.39,27.27 6.39,27.28 ; 6.28,28.27 5.22,28.28 4.96,28.02 ; 4.95,27.49 4.94,27.5 4.94,27.96 ; 4.95,27.49 4.95,27.48 ; 4.95,27.49 5.17,27.27 6.39,27.27
$1N414: length 14.3
  Top Layer w0.254: R20.1 17.14,28.8 15.44,28.8 14.4,27.77 8.78,27.77 ; 17.11,28.98 17.19,29.06 ; 8.78,27.77 7.78,28.77 6.32,28.77 ; 8.78,27.77 6.32,27.77
$1N435: length 6.3
  Top Layer w0.508: LED1.2 7.92,40.37 7.94,40.39
$1N437: length 2.1
  Top Layer w0.889: D8.1 13.3,23.52 F1.1
$1N442: length 2.3
  Top Layer w0.381: 65.45,15.89 64.78,15.89 64.16,16.51 R10.1
$1N443: length 2.3
  Top Layer w0.381: R9.1 64.21,14.48 64.83,15.09 65.45,15.09
$2N13: length 3.6
  Top Layer w0.381: Q4.4 14.02,6.59 R39.2
  Top Layer w0.635: 15.88,6.42 15.69,6.6 R39.2
$2N41: length 21.3
  Top Layer w0.889: 25.72,16.16 30.22,16.16 32.15,14.23 32.15,5.88 31.85,5.59 28.65,5.59 28.37,5.31 U17.3
$2N58: length 3.3
  Top Layer w0.508: Q5.3 32.76,47.1 U10.2
$2N72: length 1.8
  Top Layer w0.508: 35.47,49.12 33.73,49.12 Q5.1
$2N73: length 1.8
  Top Layer w0.508: 31.82,50.9 Q5.2

## Copper pours and planes (outline as drawn; the poured copper is in the pictures)
GND on Top Layer: 0,56.03 88.04,56.03 88.04,0 0,0
GND on Bottom Layer: -0.04,56.01 87.94,56.01 87.94,0.1 -0.04,0.1
VBUS on Top Layer: 7.21,25.96 9.49,25.96 9.49,22.34 7.21,22.34
VBUS on Bottom Layer: 7.16,30.9 9.5,30.9 9.5,25.09 7.16,25.09
VCC_24V on Top Layer: 7.55,10.15 10.76,10.15 10.76,5.81 7.55,5.81
$2N66 on Top Layer: 13.72,4.54 23.92,4.54 23.92,2.23 13.72,2.23
$2N68 on Top Layer: 8.13,5.18 13.12,5.18 13.12,2.84 8.13,2.84

## Text on the board
Bottom Silkscreen Layer: IO0 | EN | RX0 | TX0 | GND | 3V3 | C | D | B | A | ESP-DMX-RDM-RZ / PixelBridge v1.1 | F111 Studio
Top Silkscreen Layer: RESET | RZ_CODE | RDM/DMX
